# EasyEDA Pro project RM26.epro, schematic Schematic4
Board Name: Board4; Create Date: 2026-03-27; Page Name: P1; Project Name: 功控最终版1; Schematic Name: Schematic4; Update Date: 2026-10-28; Company: 嘉立创EDA; Page Size: A0; Version: V1.0
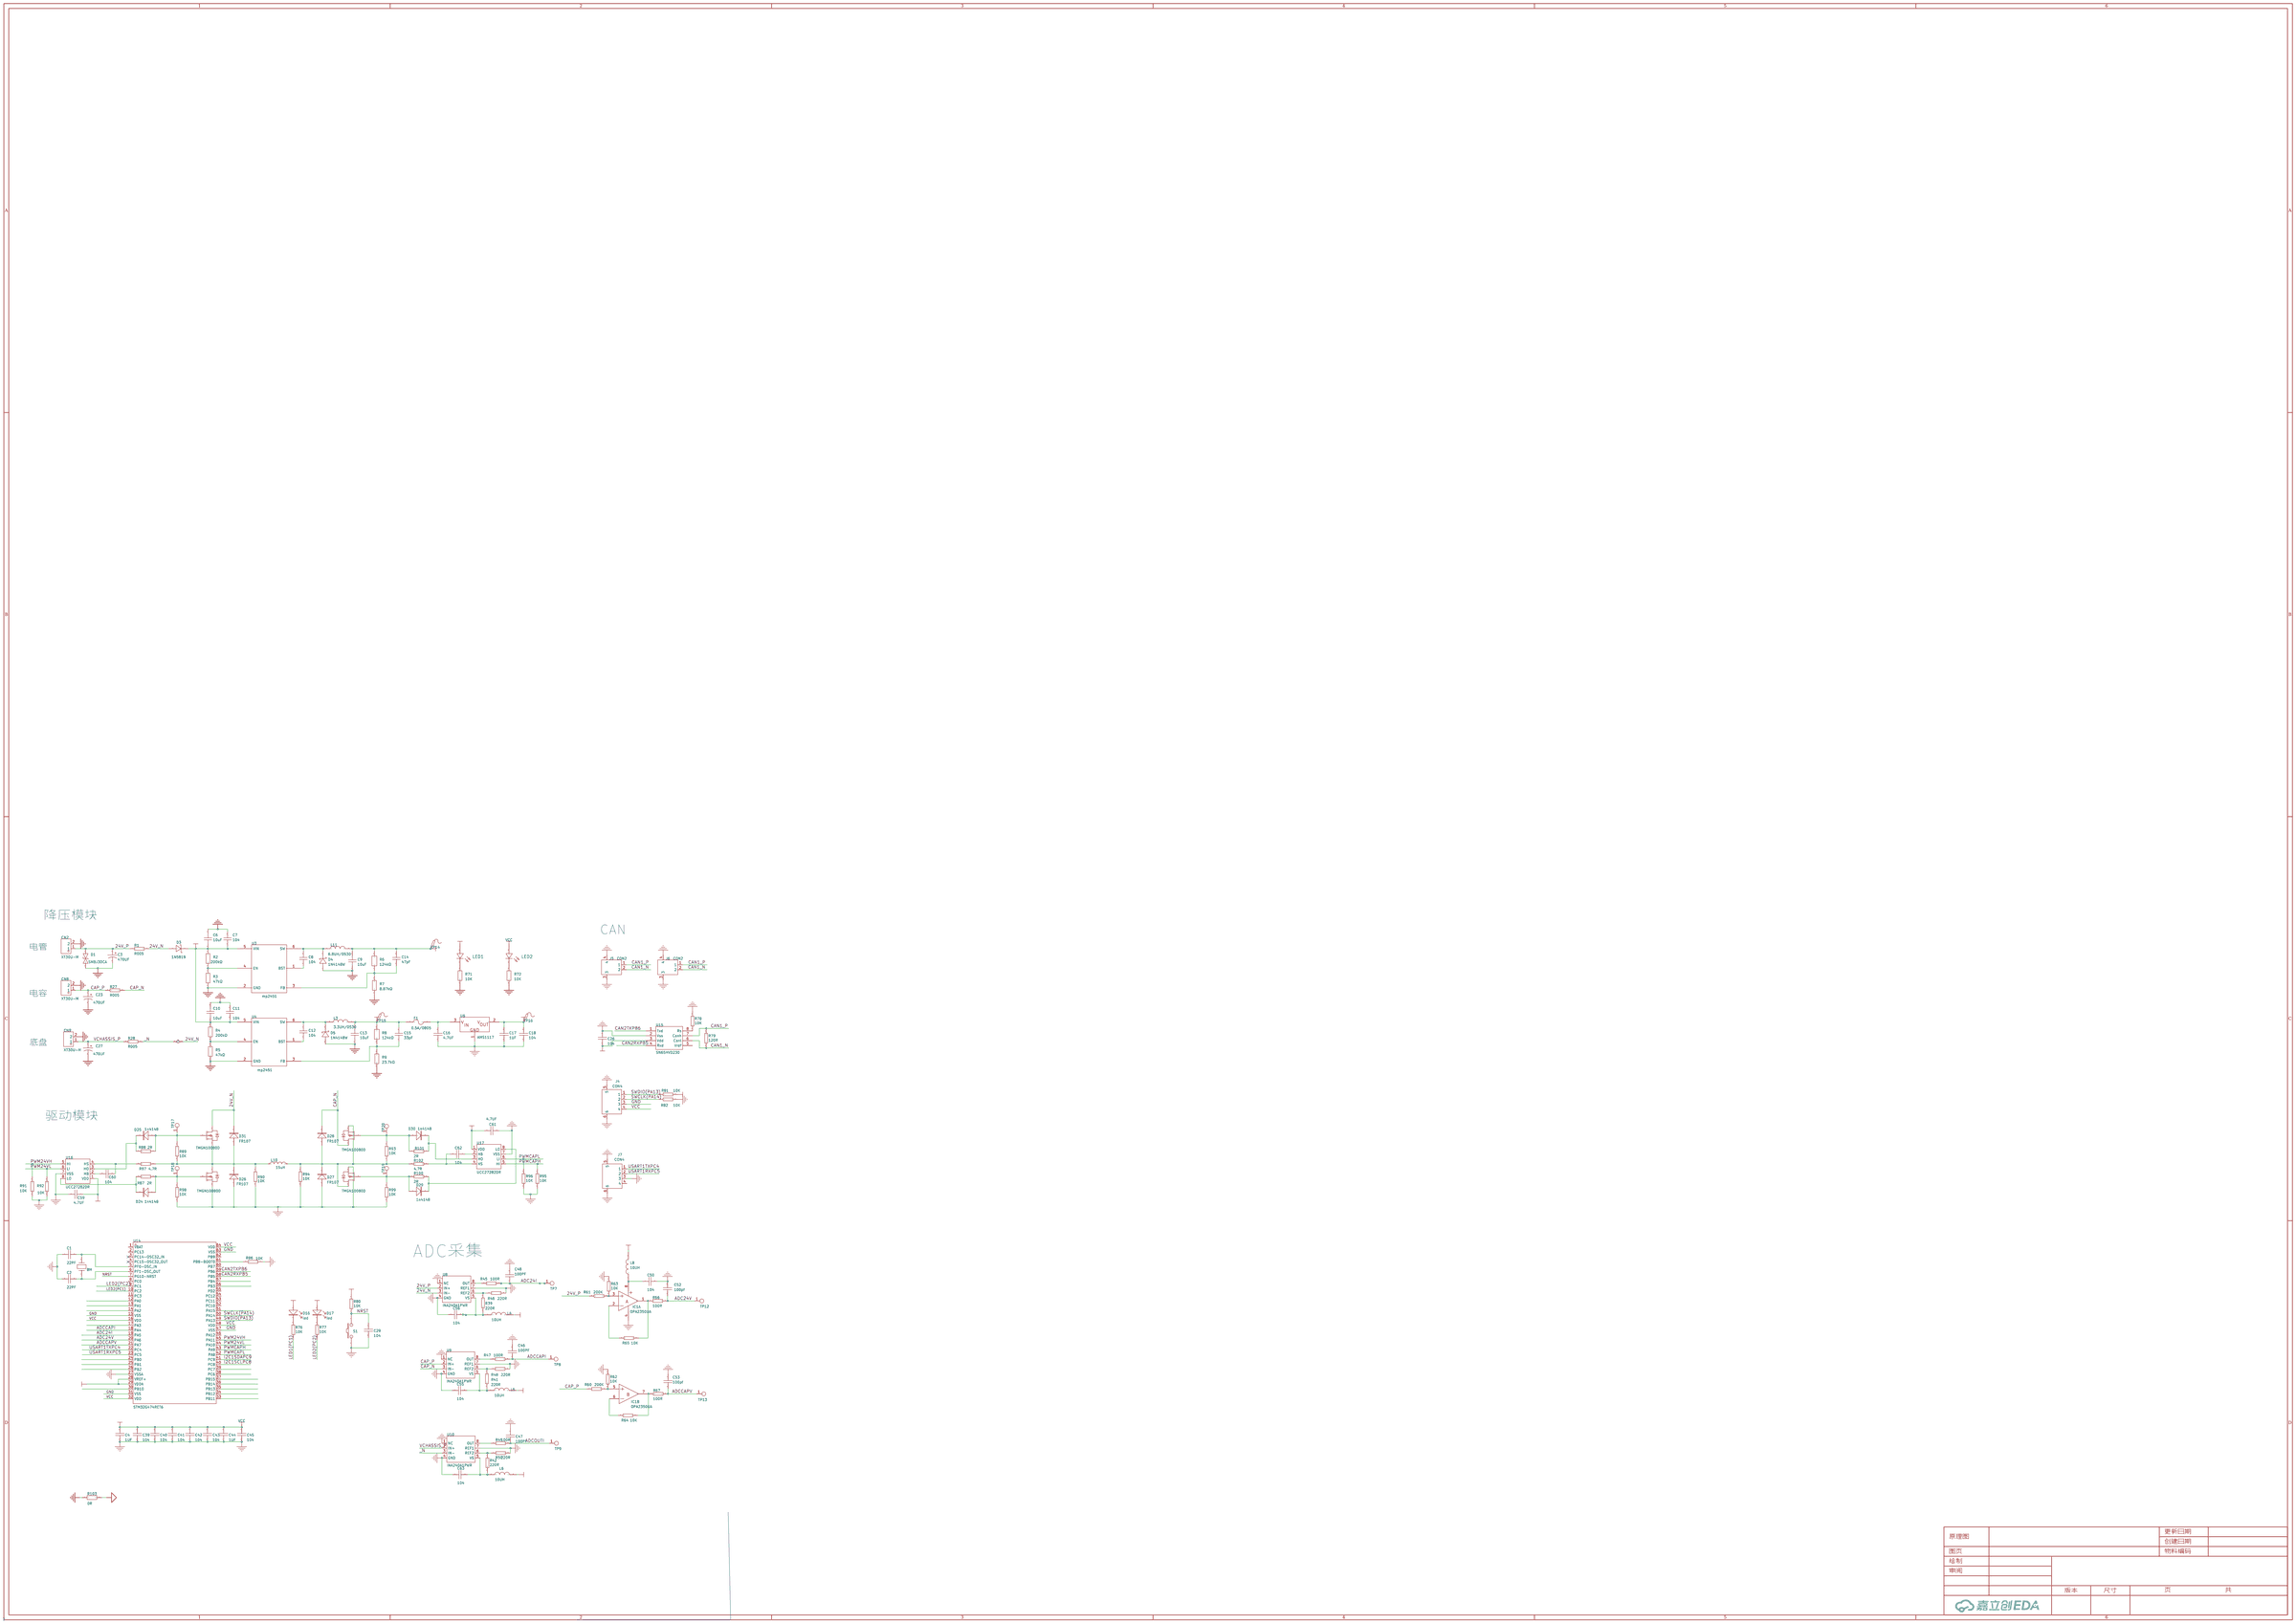
[diagram p1: schematic sheet]

## Parts
C1  22PF  [0805-C]
C2  22PF  [0805-C]
C3  470UF  [C-电解电容]
C4  1UF  [0805-C]
C6  10uF  [C1206]
C7  104  [C0805]
C8  104  [C0805]
C9  10uF  [C1206]
C10  10uF  [C1206]
C11  104  [C0805]
C12  104  [C0805]
C13  10uF  [C1206]
C14  47pF  [C0805]
C15  33pF  [C0805]
C16  4.7UF  [0805-C]
C17  1UF  [0805-C]
C18  104  [0805-C]
C23  470UF  [C-电解电容]
C26  104  [0805-C]
C27  470UF  [C-电解电容]
C29  104  [0805-C]
C39  104  [0805-C]
C40  104  [0805-C]
C41  104  [0805-C]
C42  104  [0805-C]
C43  104  [0805-C]
C44  1UF  [0805-C]
C45  104  [0805-C]
C46  100PF  [0805-C]
C47  100PF  [0805-C]
C48  100PF  [0805-C]
C50  104  [0805-C]
C52  100pf  [0805-C]
C53  100pf  [0805-C]
C55  104  [0805-C]
C56  104  [0805-C]
C59  4.7UF  [C-1206]
C60  104  [0805-C]
C61  4.7UF  [C-1206]
C62  104  [0805-C]
C63  104  [0805-C]
CN2  XT30U-M  [CONN-TH_XT30U-M]
CN8  XT30U-M  [CONN-TH_XT30U-M]
CN9  XT30U-M  [CONN-TH_XT30U-M]
D1  SMBJ30CA  [SMA]
D3  1N5819  [SMA_L4.4-W2.6-LS5.0-RD]
D4  1N4148W  [SOD-123_L2.7-W1.6-LS3.7-FD]
D5  1N4148W  [SOD-123_L2.7-W1.6-LS3.7-FD]
D16  led  [0805-LED]
D17  led  [0805-LED]
D24  1n4148  [1n4148 sod-123]
D25  1n4148  [1n4148 sod-123]
D26  FR107  [SMA]
D27  FR107  [SMA]
D28  FR107  [SMA]
D29  1n4148  [1n4148 sod-123]
D30  1n4148  [1n4148 sod-123]
D31  FR107  [SMA]
F1  0.5A/0805  [自恢复保险丝-0805]
IC1  OPA2350UA  [OPA2350UA-SOP-8]  (sections 1,2)
J4  CON4  [GH1.25-4P  SWD]
J5  CON2  [GH1.25_2P-立]
J6  CON2  [GH1.25_2P-立]
J7  CON4  [GH1.25_4P-立]
L3  3.3UH/0530  [L-5020/5030]
L4  10UH  [0805-L]
L5  10UH  [0805-L]
L6  10UH  [0805-L]
L8  10UH  [0805-L]
L10  15uH  [IND-SMD_L16.5-W15.5]
L11  6.8UH/0530  [L-5020/5030]
LED1  -  [LED_0805]
LED2  -  [LED_0805]
Q27  TMGN10080D  [TO-252-3_L6.5-W6.1-P4.58-BR]
Q28  TMGN10080D  [TO-252-3_L6.5-W6.1-P4.58-BR]
Q29  TMGN10080D  [TO-252-3_L6.5-W6.1-P4.58-BR]
Q30  TMGN10080D  [TO-252-3_L6.5-W6.1-P4.58-BR]
R1  R005  [R-2512]
R2  200kΩ  [R0805]
R3  47kΩ  [R0805]
R4  200kΩ  [R0805]
R5  47kΩ  [R0805]
R6  124kΩ  [R0805]
R7  8.87kΩ  [R0805]
R8  124kΩ  [R0805]
R9  23.7kΩ  [R0805]
R27  R005  [R-2512]
R28  R005  [R-2512]
R39  220R  [0805-R]
R41  220R  [0805-R]
R42  220R  [0805-R]
R45  100R  [0805-R]
R46  220R  [0805-R]
R47  100R  [0805-R]
R48  220R  [0805-R]
R49  100R  [0805-R]
R50  220R  [0805-R]
R60  200K  [0805-R]
R61  200K  [0805-R]
R62  10K  [0805-R]
R63  10K  [0805-R]
R64  10K  [0805-R]
R65  10K  [0805-R]
R66  100R  [0805-R]
R67  100R  [0805-R]
R71  10K  [R0805]
R72  10K  [R0805]
R76  10K  [0805-R]
R77  10K  [0805-R]
R78  10K  [0805-R]
R79  120R  [0805-R]
R80  10K  [0805-R]
R81  10K  [0805-R]
R82  10K  [0805-R]
R86  10K  [0805-R]
R87  2R  [0805-R]
R88  2R  [0805-R]
R89  10K  [0805-R]
R90  10K  [0805-R]
R91  10K  [0805-R]
R92  10K  [0805-R]
R93  10K  [0805-R]
R94  10K  [0805-R]
R95  10K  [0805-R]
R96  10K  [0805-R]
R97  4.7R  [0805-R]
R98  10K  [0805-R]
R99  10K  [0805-R]
R100  2R  [0805-R]
R101  2R  [0805-R]
R102  4.7R  [0805-R]
R103  0R  [R0805]
S1  按键  [按键]
TP7  测试点  [测试点-1MM有孔]
TP8  测试点  [测试点-1MM有孔]
TP9  测试点  [测试点-1MM有孔]
TP12  测试点  [测试点-1MM有孔]
TP13  测试点  [测试点-1MM有孔]
TP14  -  [Test-Point-0.5mm]
TP15  -  [Test-Point-0.5mm]
TP16  -  [Test-Point-0.5mm]
TP17  测试点  [测试点-1MM有孔]
TP18  测试点  [测试点-1MM有孔]
TP19  测试点  [测试点-1MM有孔]
TP20  测试点  [测试点-1MM有孔]
U3  mp2451  [MP2451-SOT23-6]
U4  mp2451  [MP2451-SOT23-6]
U6  AMS1117  [AMS117-SOT-223]
U8  INA240A1PWR  [INA240-TSSOP-8]
U9  INA240A1PWR  [INA240-TSSOP-8]
U10  INA240A1PWR  [INA240-TSSOP-8]
U14  STM32G474RET6  [LQFP-64_L10.0-W10.0-P0.50-LS12.0-BL]
U15  SN65HVD230  [SOP-8]
U16  UCC27282DR  [SOIC-8_L4.9-W3.9-P1.27-LS6.0-BL]
U17  UCC27282DR  [SOIC-8_L4.9-W3.9-P1.27-LS6.0-BL]
X1  8M  [晶振2脚-5032]

## Library data of the parts
C1 C2 = 22PF: Design Item ID: C-0805; Library Name: 2021cap1
C3 C23 C27 = 470UF: Library Name: 2021cap
C4 C17 C44 = 1UF: Design Item ID: C-0805; Library Name: 2021cap1
C6 C9 C10 C13 = HGC1206R5106K500NSPJ: 容值:10uF;精度:±10%;额定电压:50V;温度系数:X5R;; LCSC Part Name: 10uF ±10% 50V; Supplier Part: C7432781; Manufacturer: Chinocera(华瓷); Supplier Footprint: 1206; JLCPCB Part Class: 扩展库; Datasheet: https://item.szlcsc.com/datasheet/HGC1206R5106K500NSPJ/8438263.html; Supplier: LCSC; Tolerance: ±10%; Voltage Rating: 50V; Temperature Coefficient: X5R
C7 C8 C11 C12 = CL21B104KBCNNNC: 容值:100nF;精度:±10%;额定电压:50V;温度系数:X7R;; LCSC Part Name: 100nF ±10% 50V; Supplier Part: C1711; Manufacturer: SAMSUNG(三星); Supplier Footprint: 0805; JLCPCB Part Class: 扩展库; Datasheet: https://item.szlcsc.com/datasheet/CL21B104KBCNNNC/2063.html; Supplier: LCSC; Tolerance: ±10%; Voltage Rating: 50V; Temperature Coefficient: X7R
C14 = CC0805JRNPO9BN470: 容值:47pF;精度:±5%;额定电压:50V;温度系数:NP0;; LCSC Part Name: 47pF ±5% 50V; Supplier Part: C107118; Manufacturer: YAGEO(国巨); Supplier Footprint: 0805; JLCPCB Part Class: 扩展库; Datasheet: https://item.szlcsc.com/datasheet/CC0805JRNPO9BN470/108334.html; Supplier: LCSC; Tolerance: ±5%; Voltage Rating: 50V; Temperature Coefficient: NP0
C15 = 0805CG330J500NT: 容值:33pF;精度:±5%;额定电压:50V;温度系数:C0G;; LCSC Part Name: 33pF ±5% 50V; Supplier Part: C157687; Manufacturer: FH(风华); Supplier Footprint: 0805; JLCPCB Part Class: 扩展库; Datasheet: https://item.szlcsc.com/datasheet/0805CG330J500NT/169035.html; Supplier: LCSC; Tolerance: ±5%; Voltage Rating: 50V; Temperature Coefficient: C0G
C16 C59 C61 = 4.7UF: Design Item ID: C-0805; Library Name: 2021cap1
C18 C26 C29 C39-C43 C45 C50 C55 C56 C60 C62 C63 = 104: Design Item ID: C-0805; Library Name: 2021cap1
C46-C48 C52 C53 = 100pf: Design Item ID: C-0805; Library Name: 2021cap1
CN2 CN8 CN9 = XT30U-M: 类别:-;类型1:-;; LCSC Part Name: AMASS(艾迈斯)轻量版锂电池插头公头 XT30U-M; Supplier Part: C99101; Manufacturer: AMASS(艾迈斯); JLCPCB Part Class: 扩展库; Datasheet: https://item.szlcsc.com/datasheet/XT30U-M/100314.html; Supplier: LCSC; Type: 插头; Colour: 黄色; InterfaceType: 公头; Brand: 艾迈斯
D1 = SMBJ30CA: Supplier: LCSC; Supplier Part: C309968; Manufacturer: Brightking Elec (TAIWAN); Manufacturer Part: SMBJ45CA; Contributor: LCSC; JLCPCB Part Class: Extended Part; spicePre: D; spiceSymbolName: SMBJ45CA_C309968; Design Item ID: 双向二极管; Library Name: 2021cap
D3 = 1N5819_C437199: 正向压降(Vf):500mV@1A;直流反向耐压(Vr):40V;整流电流:1A;; LCSC Part Name: KEXIN(科信)原型号 SS14,后续变更为 1N5819，丝印不变。 电压:40V 电流:1A; Supplier Part: C437199; Manufacturer: KEXIN(科信); Supplier Footprint: DO-214AC(SMA); JLCPCB Part Class: 扩展库; Datasheet: https://item.szlcsc.com/datasheet/1N5819/435098.html; Supplier: LCSC; Voltage - Forward(Vf@If): 500mV@1A; Voltage - DC Reverse(Vr): 40V; Current - Rectified: 1A; Operating Junction Temperature Range: -60℃~+125℃; Non-Repetitive Peak Forward Surge Current: 40A
D4 D5 = 1N4148W_C7420318: 二极管配置:独立式;正向压降(Vf):1.25V@150mA;直流反向耐压(Vr):100V;整流电流:150mA;反向恢复时间(Trr):4ns;; Supplier Part: C7420318; Manufacturer: R+O(宏嘉诚); Supplier Footprint: SOD-123; JLCPCB Part Class: 扩展库; Datasheet: https://item.szlcsc.com/datasheet/1N4148W/8397140.html; Supplier: LCSC; Diode Configuration: 独立式; Voltage - Forward(Vf@If): 1.25V@150mA; Voltage - DC Reverse(Vr): 100V; Current - Rectified: 150mA; Pd - Power Dissipation: 400mW; Reverse Leakage Current (Ir): 1uA@75V; Reverse Recovery Time (trr): 4ns; Operating Junction Temperature Range: -55℃~+150℃; Non-Repetitive Peak Forward Surge Current: 2A
D16 D17 = led: Library Name: 2021cap1
D24 D25 D29 D30 = 1n4148: Design Item ID: 二极管; Library Name: 2021cap
D26-D28 D31 = FR107: Design Item ID: 二极管; Library Name: 2021cap
F1 = 0.5A/0805: Design Item ID: 保险丝; Library Name: 2021cap1
IC1 = OPA2350UA: 双路运放; Library Name: 2021cap
J4 = CON4: Supplier: LCSC; Supplier Part: C225113; Manufacturer: Changjiang Connectors; Manufacturer Part: A1251WR-S-4P; Contributor: LCSC; JLCPCB Part Class: Extended Part; spicePre: C; spiceSymbolName: A1251WR-S-4P; Origin Footprint 2: GH1.25_4P-立; Design Item ID: GH1.25-S-4P; Library Name: 2021cap
J5 J6 = CON2: Supplier: LCSC; Supplier Part: C225125; Manufacturer: Changjiang Connectors; Manufacturer Part: A1257WR-S-2P; Contributor: LCSC; JLCPCB Part Class: Extended Part; spicePre: C; spiceSymbolName: A1257WR-S-2P; Design Item ID: GH1.25-S-2P; Library Name: 2021cap
J7 = CON4: Supplier: LCSC; Supplier Part: C225113; Manufacturer: Changjiang Connectors; Manufacturer Part: A1251WR-S-4P; Contributor: LCSC; JLCPCB Part Class: Extended Part; spicePre: C; spiceSymbolName: A1251WR-S-4P; Origin Footprint 2: GH1.25-4P  SWD; Design Item ID: GH1.25-S-4P; Library Name: 2021cap
L3 = 3.3UH/0530: Design Item ID: L-0805; Library Name: 2021cap1
L4-L6 L8 = 10UH: Design Item ID: L-0805; Library Name: 2021cap1
L10 = YSPIT1510A-150M: 电感值:15uH;精度:±20%;额定电流:18A;饱和电流(Isat):20A;类型:一体成型电感;; LCSC Part Name: 15uH ±20% 20A; Supplier Part: C19188714; Manufacturer: YJYCOIN(益嘉源); Supplier Footprint: SMD,15.5x16.5mm; JLCPCB Part Class: 扩展库; Datasheet: https://atta.szlcsc.com/upload/public/pdf/source/20230925/52972B605C1365E022E27E403D2CE71A.pdf; Supplier: LCSC; Tolerance: ±20%; Rated Current: 18A; Saturation Current (Isat): 20A; DC Resistance (DCR): 11.5mΩ; Type: 一体成型电感
L11 = 6.8UH/0530: Design Item ID: L-0805; Library Name: 2021cap1
LED1 LED2 = LED_0805-R: Supplier Footprint: 0805
Q27-Q30 = TMGN10080D: 数量:1个N沟道;漏源电压(Vdss):100V;连续漏极电流(Id):80A;导通电阻(RDS(on)):7.2mΩ@10V;耗散功率(Pd):-;阈值电压(Vgs(th)):1V;; LCSC Part Name: 1个N沟道 耐压:100V 电流:80A; Supplier Part: C7422902; Manufacturer: TMC(台懋); Supplier Footprint: TO-252-3L; JLCPCB Part Class: 扩展库; Datasheet: https://item.szlcsc.com/datasheet/TMGN10080D/8406151.html; Supplier: LCSC; Number: 1个N沟道; Drain to Source Voltage: 100V; Current - Continuous Drain(Id): 80A; RDS(on): 7.2mΩ@10V; Gate Threshold Voltage (Vgs(th)): 1V; Gate Charge(Qg): 10nC@10V; Input Capacitance(Ciss): 2nF@15V; Reverse Transfer Capacitance (Crss@Vds): 12pF@15V
R1 R27 R28 = R005: nameAlias: Value(Ω); Contributor: LCEDA_Lib; spicePre: R; spiceSymbolName: R_0201_US; Design Item ID: R-0805; Library Name: 2021cap1
R2 R4 = 0805W8F2003T5E: 电阻类型:厚膜电阻;阻值:200kΩ;精度:±1%;功率:125mW;最大工作电压:150V;温度系数:±100ppm/℃;; LCSC Part Name: 200kΩ ±1% 125mW 厚膜电阻; Supplier Part: C17539; Manufacturer: UNI-ROYAL(厚声); Supplier Footprint: 0805; JLCPCB Part Class: 基础库; Datasheet: https://atta.szlcsc.com/upload/public/pdf/source/20200306/C422600_1E6D84923E4A46A82E41ADD87F860B5C.pdf; Supplier: LCSC; Type: 厚膜电阻; Tolerance: ±1%; Power(Watts): 125mW; Overload Voltage (Max): 150V; Temperature Coefficient: ±100ppm/℃; Operating Temperature Range: -55℃~+155℃
R3 R5 = 0805W8F4702T5E: 电阻类型:厚膜电阻;阻值:47kΩ;精度:±1%;功率:125mW;工作电压:150V;温度系数:±100ppm/℃;; LCSC Part Name: 47kΩ ±1% 125mW 厚膜电阻; Supplier Part: C17713; Manufacturer: UNI-ROYAL(厚声); Supplier Footprint: 0805; JLCPCB Part Class: 基础库; Datasheet: https://item.szlcsc.com/datasheet/0805W8F4702T5E/18401.html; Supplier: LCSC; Type: 厚膜电阻; Tolerance: ±1%; Power(Watts): 125mW; Voltage-Supply(Max): 150V; Temperature Coefficient: ±100ppm/℃; Operating Temperature: -55℃~+155℃
R6 R8 = FRC0805F1243TS: 电阻类型:厚膜电阻;阻值:124kΩ;精度:±1%;功率:125mW;工作电压:150V;温度系数:±100ppm/℃;; LCSC Part Name: 124kΩ ±1% 125mW 厚膜电阻; Supplier Part: C2933298; Manufacturer: FOJAN(富捷); Supplier Footprint: 0805; JLCPCB Part Class: 扩展库; Supplier: LCSC; Type: 厚膜电阻; Tolerance: ±1%; Power(Watts): 125mW; Voltage-Supply(Max): 150V; Temperature Coefficient: ±100ppm/℃; Operating Temperature: -55℃~+155℃
R7 = 0805W8F8871T5E: 电阻类型:厚膜电阻;阻值:8.87kΩ;精度:±1%;功率:125mW;工作电压:150V;温度系数:±100ppm/℃;; LCSC Part Name: 8.87kΩ ±1% 125mW 厚膜电阻; Supplier Part: C37551; Manufacturer: UNI-ROYAL(厚声); Supplier Footprint: 0805; JLCPCB Part Class: 扩展库; Datasheet: https://item.szlcsc.com/datasheet/0805W8F8871T5E/38531.html; Supplier: LCSC; Type: 厚膜电阻; Tolerance: ±1%; Power(Watts): 125mW; Voltage-Supply(Max): 150V; Temperature Coefficient: ±100ppm/℃; Operating Temperature: -55℃~+155℃
R9 = RT0805BRD0723K7L: 电阻类型:薄膜电阻;阻值:23.7kΩ;精度:±0.1%;功率:125mW;最大工作电压:150V;温度系数:±25ppm/℃;; LCSC Part Name: 薄膜电阻 23.7kΩ ±0.1% 125mW; Supplier Part: C309659; Manufacturer: YAGEO(国巨); Supplier Footprint: 0805; JLCPCB Part Class: 扩展库; Datasheet: https://atta.szlcsc.com/upload/public/pdf/source/20181009/C309664_C7CEF5A7F4D0541F96EF5E54D941D229.pdf; Supplier: LCSC; Type: 薄膜电阻; Tolerance: ±0.1%; Power(Watts): 125mW; Overload Voltage (Max): 150V; Temperature Coefficient: ±25ppm/℃; Operating Temperature Range: -55℃~+155℃
R39 R41 R42 R46 R48 R50 = 220R: nameAlias: Value(Ω); Contributor: LCEDA_Lib; spicePre: R; spiceSymbolName: R_0201_US; Design Item ID: R-0805; Library Name: 2021cap1
R45 R47 R49 R66 R67 = 100R: nameAlias: Value(Ω); Contributor: LCEDA_Lib; spicePre: R; spiceSymbolName: R_0201_US; Design Item ID: R-0805; Library Name: 2021cap1
R60 R61 = 200K: nameAlias: Value(Ω); Contributor: LCEDA_Lib; spicePre: R; spiceSymbolName: R_0201_US; Design Item ID: R-0805; Library Name: 2021cap1
R62-R65 R76-R78 R80-R82 R86 R89-R96 R98 R99 = 10K: nameAlias: Value(Ω); Contributor: LCEDA_Lib; spicePre: R; spiceSymbolName: R_0201_US; Design Item ID: R-0805; Library Name: 2021cap1
R71 R72 R103 = Res_0805: Supplier Footprint: 0805
R79 = 120R: nameAlias: Value(Ω); Contributor: LCEDA_Lib; spicePre: R; spiceSymbolName: R_0201_US; Design Item ID: R-0805; Library Name: 2021cap1
R87 R88 R97 R100-R102 = 2R: nameAlias: Value(Ω); Contributor: LCEDA_Lib; spicePre: R; spiceSymbolName: R_0201_US; Design Item ID: R-0805; Library Name: 2021cap1
S1 = 按键: Library Name: 2021cap1
TP7-TP9 TP12 TP13 TP17-TP20 = 测试点: Library Name: 2021cap
TP14-TP16 = Test-Point: Test Point 测试点
U3 U4 = mp2451: Library Name: 2021cap
U6 = AMS1117: Library Name: 2021cap
U8-U10 = INA240A1PWR: TSSOP-8; Supplier: LCSC; Manufacturer: TI; Contributor: LCSC; Supplier Part: C93965; JLCPCB Part Class: Extended Part; spicePre: U; Library Name: 2021cap
U14 = STM32G474RET6: CPU内核:ARM-M4;CPU最大主频:170MHz;应用领域:-;; LCSC Part Name: 带DSP和FPU的170MHz主流ARM Cortex-M4 MCU，具有512 KB Flash存储器、数学加速器、高分辨率定时器和高模拟电平集成; Supplier Part: C521608; Manufacturer: ST(意法半导体); Supplier Footprint: LQFP-64(10x10); JLCPCB Part Class: 扩展库; Datasheet: https://item.szlcsc.com/datasheet/STM32G474RET6/538858.html; Supplier: LCSC; CPU Core: ARM-M4; CPU Maximum Speed: 170MHz; Program Storage Size: 512KB; Program Memory Type: FLASH; Number of I/O: 52; ADC (Bit): 12bit; DAC (Bit): 12bit; Voltage - Supply: 1.71V~3.6V
U15 = SN65HVD230: Supplier: LCSC; Manufacturer: NXP; Manufacturer Part: TJA1050T/CM,118; image: //image.lceda.cn/szlcsc/C6952.jpg; Supplier Part: C6952; JLCPCB Part Class: Basic; JLCPCB SMD: Yes; spicePre: U; spiceSymbolName: TJA1050T/CM,118; Library Name: 2021cap
U16 U17 = UCC27282DR: 驱动配置:半桥;负载类型:MOSFET;驱动通道数:2;灌电流(IOL):3A;拉电流(IOH):3A;工作电压:5.5V~16V;上升时间(tr):12ns;下降时间(tf):10ns;; LCSC Part Name: 具有跨导保护和低开关损耗的3A 120V半桥驱动器; Supplier Part: C2867844; Manufacturer: TI(德州仪器); Supplier Footprint: SOIC-8; JLCPCB Part Class: 扩展库; Datasheet: https://www.ti.com/cn/lit/gpn/ucc27282; Supplier: LCSC; Driven Configuration: 半桥; Load Type: MOSFET; Number of Drivers: 2; Current - Output Low(IOL): 3A; Current - Output High(IOH): 3A; Voltage - Supply: 5.5V~16V; Rise Time: 12ns; Fall Time: 10ns; Propagation Delay tpLH: 16ns; Propagation Delay tpHL: 16ns; Features: 欠压保护(UVP); Operating Temperature: -40℃~+140℃; Input Logic Level - High: 1.9V~2.4V; Input Logic Level - Low: 900mV~1.3V; Quiescent Current(Iq): 300uA
X1 = 8M: Design Item ID: 晶振; Library Name: 2021cap1

## Nets
5V: C13.2 C15.1 F1.1 L3.2 R8.2 TP15.1
12V: C9.2 C14.2 C59.1 C61.2 L11.2 LED1.2(A) R6.2 TP14.1 U16.1(VDD) U17.1(VDD)
24V: C6.1 C7.1 C10.1 C11.1 D3.1(C) R2.2 R4.2 U3.5(VIN) U4.5(VIN)
24V_N: D3.2(A) D31.2 Q27.2(D) R1.2 R28.2 U8.3(IN-) U10.3(IN-)
24V_P: C3.1 CN2.1 D1.2(A) R1.1 R61.1 U8.2(IN+)
AGND: R103.2
GND: C1.1 C2.2 C3.2 C4.2 C6.2 C7.2 C9.1 C10.2 C11.2 C13.1 C16.2 C17.2 C18.2 C23.2 C26.1 C27.2 C29.2 C39.2 C40.2 C41.2 C42.2 C43.2 C44.2 C45.2 C46.2 C47.2 C48.2 C50.2 C52.2 C53.2 C55.1 C56.1 C59.2 C61.1 C63.1 CN2.2 CN8.2 CN9.2 D1.1(K) D4.1(A) D5.1(A) D26.1 D27.1 IC1.4(V-) J4.3 J4.5 J4.6 J5.3 J5.4 J6.3 J6.4 J7.3 J7.5 J7.6 Q28.3(S) Q30.3(S) R3.1 R5.1 R7.1 R9.1 R46.2 R48.2 R50.2 R62.1 R63.1 R71.1 R72.1 R78.1 R82.2 R86.1 R90.2 R91.2 R92.2 R94.2 R95.2 R96.2 R98.1 R99.1 R103.1 S1.1 U3.2(GND) U4.2(GND) U6.1(GND) U8.1(NC) U8.4(GND) U8.7(REF1) U9.1(NC) U9.4(GND) U9.7(REF1) U10.1(NC) U10.4(GND) U10.7(REF1) U14.15(VSS) U14.31(VSS) U14.47(VSS) U14.63(VSS) U15.2(Vss) U16.7(VSS) U17.7(VSS)
VCC: C4.1 C17.1 C18.1 C26.2 C39.1 C40.1 C41.1 C42.1 C43.1 C44.1 C45.1 D16.1 D17.1 J4.4 L4.2 L5.2 L6.2 L8.2 LED2.2(A) R80.2 R81.1 TP16.1 U6.2(VOUT) U14.16(VDD) U14.32(VDD) U14.48(VDD) U14.64(VDD) U15.3(Vdd)
VDDA: U14.28(VREF+) U14.29(VDDA)
VSSA: U14.27(VSSA)
ADC24I: C48.1 R45.2 TP7.1 U14.19(PA5)
ADC24V: C52.1 R66.2 TP12.1 U14.20(PA6)
ADCCAPI: C46.1 R47.2 TP8.1 U14.18(PA4)
ADCCAPV: C53.1 R67.2 TP13.1 U14.21(PA7)
ADCOUTI: C47.1 R49.2 TP9.1
CAN1_N: J5.2 J6.2 R79.2 U15.6(Canl)
CAN1_P: J5.1 J6.1 R79.1 U15.7(Canh)
CAN2RXPB5: U14.58(PB5) U15.4(Rxd)
CAN2TXPB6: U14.59(PB6) U15.1(Txd)
CAP_N: D28.2 Q29.2(D) R27.2 U9.3(IN-)
CAP_P: C23.1 CN8.1 R27.1 R60.1 U9.2(IN+)
I2C1SCLPC8: U14.40(PC8)
I2C1SDAPC9: U14.41(PC9)
LED1(PC1): R76.2
LED2(PC1): U14.10(PC2)
LED2(PC2): R77.2 U14.9(PC1)
NRST: C29.1 R80.1 S1.2 U14.7(PG10-NRST)
PWM24VH: R91.1 U14.45(PA11) U16.5(HI)
PWM24VL: R92.1 U14.44(PA10) U16.6(LI)
PWMCAPH: R95.1 U14.43(PA9) U17.5(HI)
PWMCAPL: R96.1 U14.42(PA8) U17.6(LI)
SWCLK(PA14): J4.2 R82.1 U14.50(PA14)
SWDIO(PA13): J4.1 R81.2 U14.49(PA13)
USART1RXPC5: J7.2 U14.23(PC5)
USART1TXPC4: J7.1 U14.22(PC4)
VCHASSIS_P: C27.1 CN9.1 R28.1 U10.2(IN+)
Net-(C1-2): C1.2 U14.5(PF0-OSC_IN) X1.2
Net-(C2-1): C2.1 U14.6(PF1-OSC_OUT) X1.1
Net-(C8-1): C8.1 U3.1(BST)
Net-(C8-2): C8.2 D4.2(K) L11.1 U3.6(SW)
Net-(C12-1): C12.1 U4.1(BST)
Net-(C12-2): C12.2 D5.2(K) L3.1 U4.6(SW)
Net-(C14-1): C14.1 R6.1 R7.2 U3.3(FB)
Net-(C15-2): C15.2 R8.1 R9.2 U4.3(FB)
Net-(C16-1): C16.1 F1.2 U6.3(VIN)
Net-(C50-1): C50.1 IC1.8(V+) L8.1
Net-(C55-2): C55.2 L5.1 R41.2 U9.5(VS)
Net-(C56-2): C56.2 L4.1 R39.2 U8.5(VS)
Net-(C60-1): C60.1 U16.2(HB)
Net-(C60-2): C60.2 R97.2 U16.4(HS)
Net-(C62-1): C62.1 R102.2 U17.4(HS)
Net-(C62-2): C62.2 U17.2(HB)
Net-(C63-2): C63.2 L6.1 R42.2 U10.5(VS)
Net-(D16-2): D16.2 R76.1
Net-(D17-2): D17.2 R77.1
Net-(D24-1): D24.1 Q28.1(G) R87.1 R98.2 TP18.1
Net-(D24-2): D24.2 R87.2 U16.8(LO)
Net-(D25-1): D25.1 Q27.1(G) R88.1 R89.1 TP17.1
Net-(D25-2): D25.2 R88.2 U16.3(HO)
Net-(D26-2): D26.2 D31.1 L10.1 Q27.3(S) Q28.2(D) R89.2 R90.1 R97.1
Net-(D27-2): D27.2 D28.1 L10.2 Q29.3(S) Q30.2(D) R93.2 R94.1 R102.1
Net-(D29-1): D29.1 Q30.1(G) R99.2 R100.1 TP19.1
Net-(D29-2): D29.2 R100.2 U17.8(LO)
Net-(D30-1): D30.1 Q29.1(G) R93.1 R101.1 TP20.1
Net-(D30-2): D30.2 R101.2 U17.3(HO)
Net-(IC1-1): IC1.1(OUT) R65.1 R66.1
Net-(IC1-2): IC1.2(IN-) R65.2
Net-(IC1-3): IC1.3(IN+) R61.2 R63.2
Net-(IC1-5): IC1.5(IN+) R60.2 R62.2
Net-(IC1-6): IC1.6(IN-) R64.2
Net-(IC1-7): IC1.7(OUT) R64.1 R67.1
Net-(LED1-1): LED1.1(C) R71.2
Net-(LED2-1): LED2.1(C) R72.2
Net-(R2-1): R2.1 R3.2 U3.4(EN)
Net-(R4-1): R4.1 R5.2 U4.4(EN)
Net-(R39-1): R39.1 R46.1 U8.6(REF2)
Net-(R41-1): R41.1 R48.1 U9.6(REF2)
Net-(R42-1): R42.1 R50.1 U10.6(REF2)
Net-(R45-1): R45.1 U8.8(OUT)
Net-(R47-1): R47.1 U9.8(OUT)
Net-(R49-1): R49.1 U10.8(OUT)
Net-(R78-2): R78.2 U15.8(Rs)
Net-(R86-2): R86.2 U14.61(PB8-BOOT0)

Not connected (* = marked no-connect by the designer): J7 4; U14 1(VBAT) 2(PC13) 3(PC14-OSC32_IN)* 4(PC15-OSC32_OUT)* 8(PC0) 11(PC3) 12(PA0) 13(PA1) 14(PA2) 17(PA3) 24(PB0) 25(PB1) 26(PB2) 30(PB10) 33(PB11) 34(PB12) 35(PB13) 36(PB14) 37(PB15) 38(PC6) 39(PC7) 46(PA12) 51(PA15) 52(PC10) 53(PC11) 54(PC12) 55(PD2) 56(PB3) 57(PB4) 60(PB7) 62(PB9); U15 5(Vref)

## Notes on the sheet
- 降压模块
- CAN
- 电管
- 电容
- 底盘
- 驱动模块
- ADC采集
